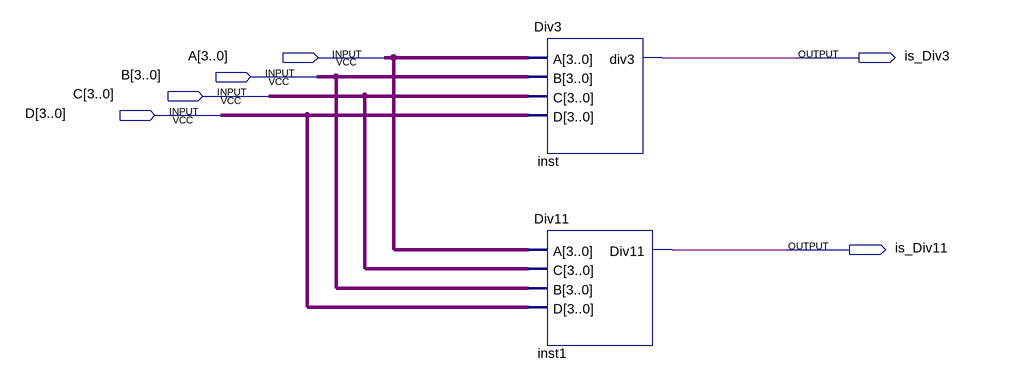
[diagram p0: schematic sheet]
// Quartus schematic final.bdf as structural Verilog: 2 symbols, 6 pins
module \final  (
  input  [3:0] A,
  input  [3:0] B,
  input  [3:0] C,
  input  [3:0] D,
  output is_Div3,
  output is_Div11
);

  Div3 inst (.A(A), .B(B), .C(C), .D(D), .div3(is_Div3));
  Div11 inst1 (.A(A), .C(C), .B(B), .D(D), .Div11(is_Div11));
endmodule
